# Altium schematic sheet Sheet1.SchDoc
size A3; SheetNumber: 1; SheetTotal: 1
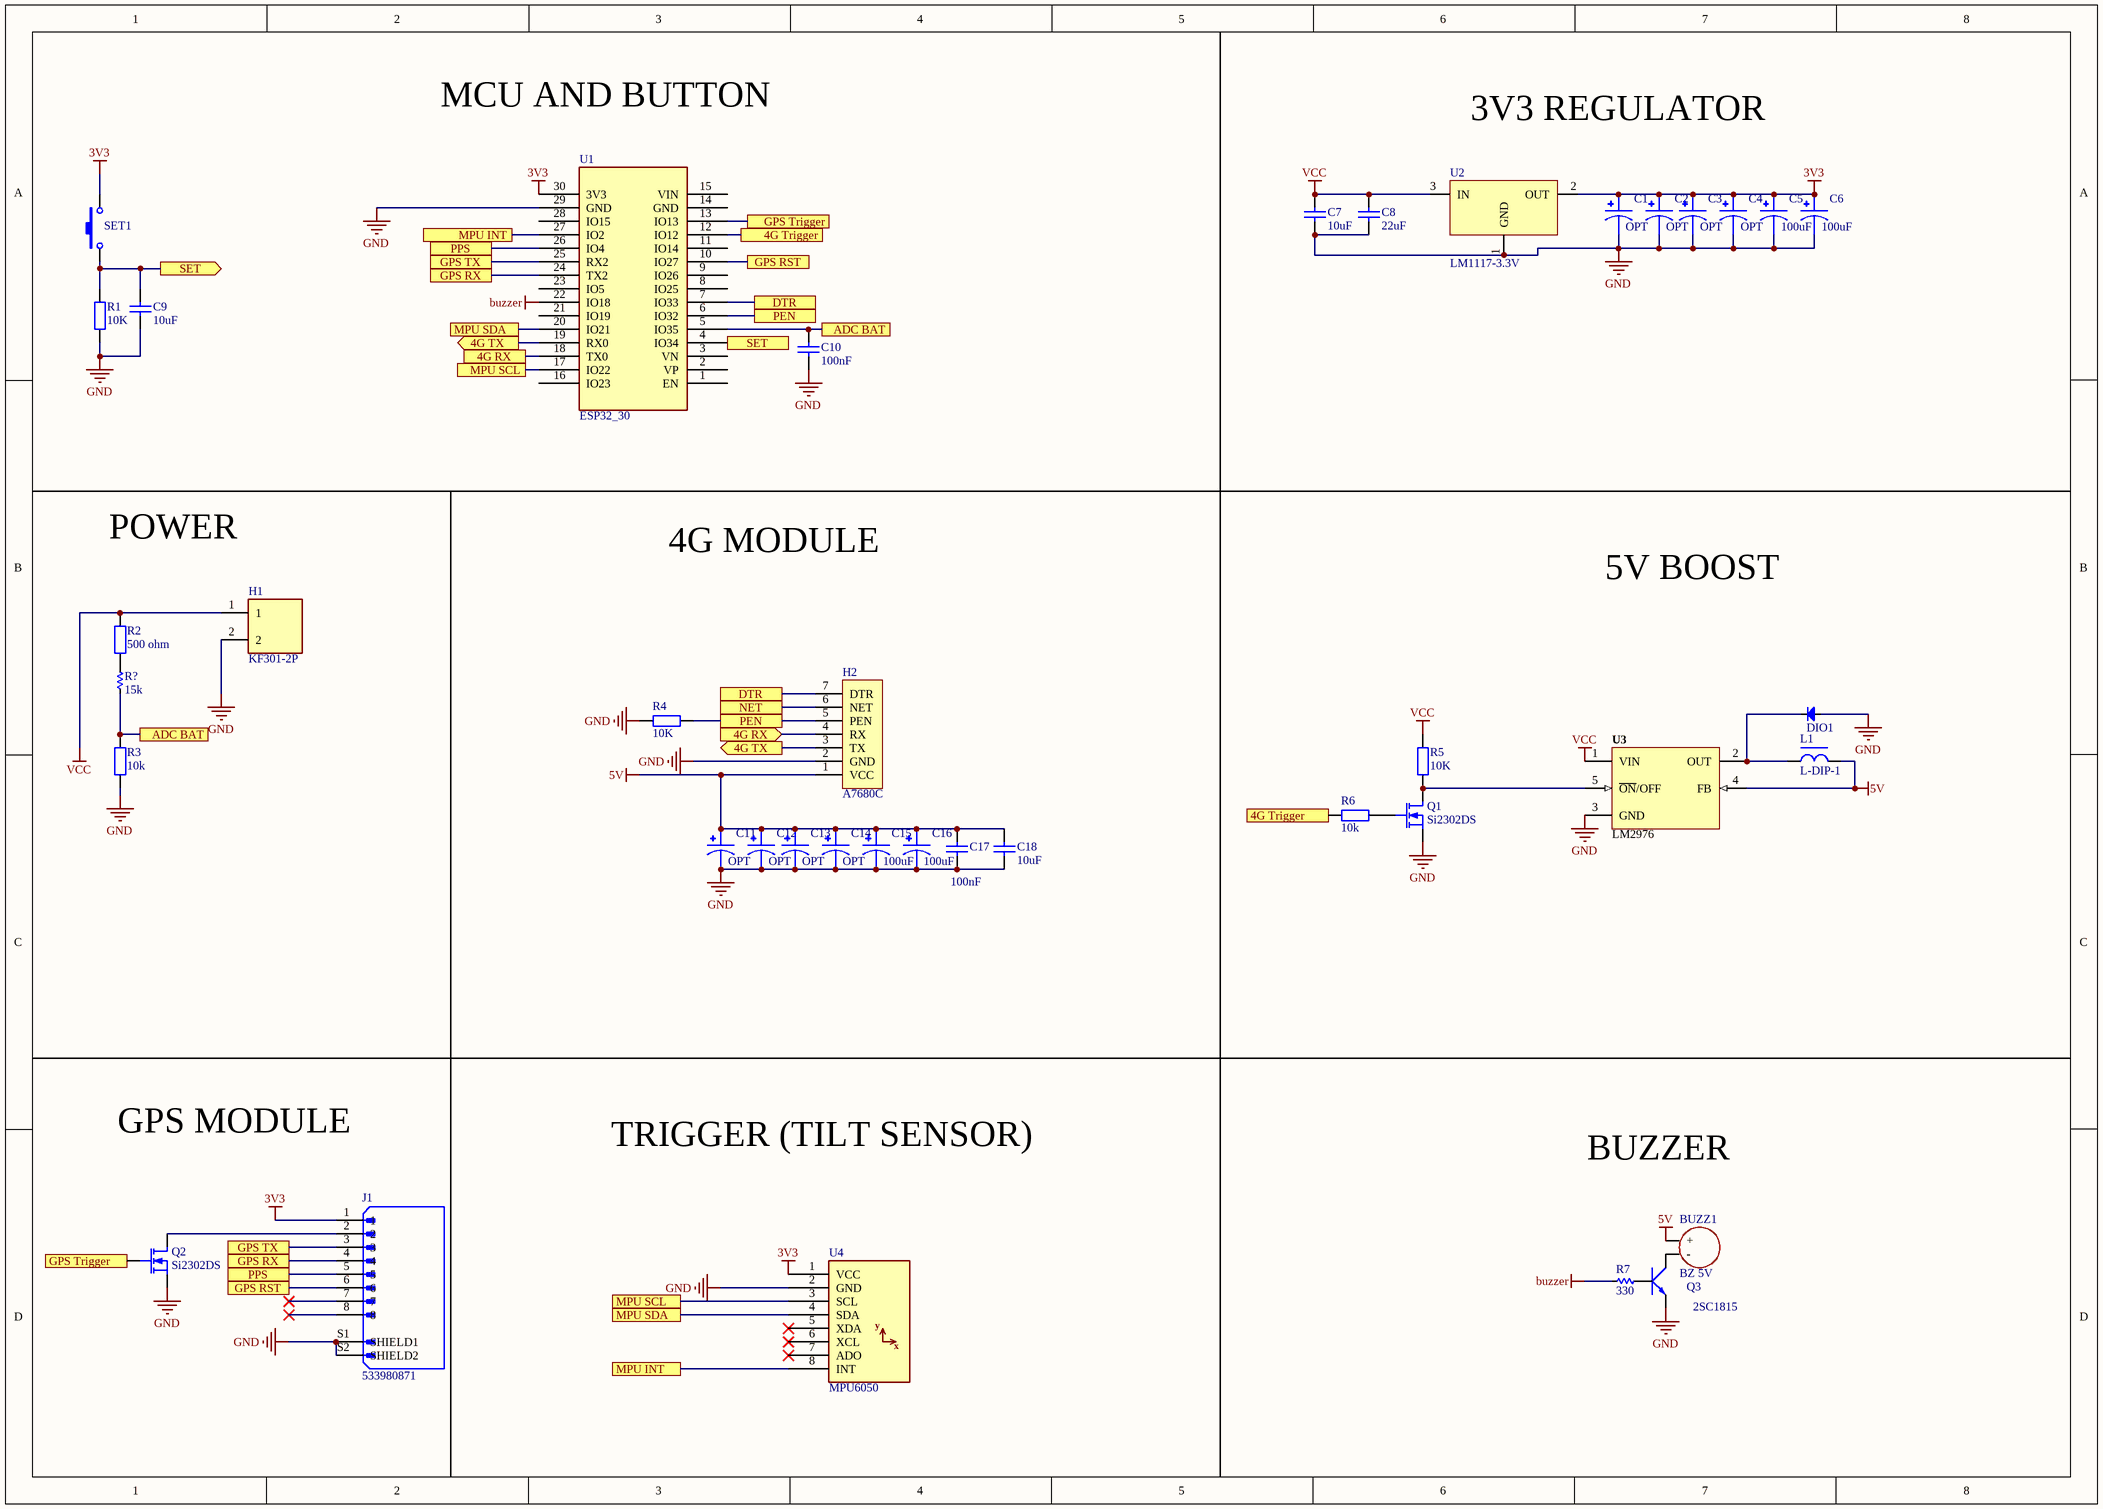
[diagram p0: Sheet1.SchDoc]

## Parts
BUZZ1  BZ 5V  [BUZ_9MM]
C1  OPT  [1206_Tantalum]
C2  OPT  [1206_Tantalum]
C3  OPT  [2312_Tantalum]
C4  OPT  [2312_Tantalum]
C5  100uF  [2917 _Tantalum]
C6  100uF  [2917 _Tantalum]
C7  10uF  [0805_Cap]
C8  22uF  [0805_Cap]
C9  10uF  [0805_Cap]
C10  100nF  [0805_Cap]
C11  OPT  [1206_Tantalum]
C12  OPT  [1206_Tantalum]
C13  OPT  [2312_Tantalum]
C14  OPT  [2312_Tantalum]
C15  100uF  [2917 _Tantalum]
C16  100uF  [2917 _Tantalum]
C17  100nF  [0805_Cap]
C18  10uF  [0805_Cap]
DIO1  Diode SMD  [DIO-SMD-A]  (value not drawn)
H1  KF301-2P  [HANDSON_KF301-2P]
H2  A7680C  [Module A7680C]
J1  533980871  [MOLEX_533980871]
L1  L-DIP-1  [L-DIP-M-15.5x8]
Q1  Si2302DS  [SOT23-132]
Q2  Si2302DS  [SOT23-132]
Q3  2SC1815  [SOT23-321]
R1  10K  [0805_Res]
R2  500 ohm  [0805_Res]
R3  10k  [0805_Res]
R4  10K  [0805_Res]
R5  10K  [0805_Res]
R6  10k  [0805_Res]
R7  330  [RES-SMD-0805]
R?  15k  [RES-SMD-0805]
SET1  Button 2p  [Button 2p 3x6x2.5]  (value not drawn)
U1  ESP32_30  [ESP32_30]
U2  LM1117-3.3V  [TO220NH]
U3  LM2976  [TO263]
U4  MPU6050  [MPU6050]

## Ports
4G RX, 4G RX (in), 4G Trigger, 4G TX (out), ADC BAT, DTR, GPS RST, GPS RX, GPS Trigger, GPS TX, MPU INT, MPU SCL, MPU SDA, NET, PEN, PPS, SET (out)

## Nets
3V3: C1.1 C2.1 C3.1 C4.1 C5.1 C6.1 J1.1 SET1.2 U1.30(3V3) U2.2(OUT) U4.1(VCC)
5V: BUZZ1.1(+) C11.1 C12.1 C13.1 C14.1 C15.1 C16.1 C17.1 C18.2 H2.1(VCC) L1.2 U3.4(FB)
buzzer: R7.2 U1.22(IO18)
GND: C1.2 C2.2 C3.2 C4.2 C5.2 C6.2 C7.1 C8.2 C9.2 C10.1 C11.2 C12.2 C13.2 C14.2 C15.2 C16.2 C17.2 C18.1 DIO1.1(A) H1.2 H2.2(GND) J1.S1(SHIELD1) J1.S2(SHIELD2) Q1.2(S) Q2.2(S) Q3.1(E) R1.1 R3.1 R4.2 U1.29(GND) U2.1(GND) U3.3(GND) U4.2(GND)
VCC: C7.2 C8.1 H1.1 R2.2 R5.2 U2.3(IN) U3.1(VIN)
4G RX: H2.4(RX) U1.18(TX0) ; port 4G RX
4G Trigger: R6.2 U1.12(IO12) ; port 4G Trigger
4G TX: H2.3(TX) U1.19(RX0) ; port 4G TX
ADC BAT: C10.2 R3.2 R?.2 U1.5(IO35) ; port ADC BAT
DTR: H2.7(DTR) U1.7(IO33) ; port DTR
GPS RST: J1.6 U1.10(IO27) ; port GPS RST
GPS RX: J1.4 U1.24(TX2) ; port GPS RX
GPS Trigger: Q2.1(G) U1.13(IO13) ; port GPS Trigger
GPS TX: J1.3 U1.25(RX2) ; port GPS TX
MPU INT: U1.27(IO2) U4.8(INT) ; port MPU INT
MPU SCL: U1.17(IO22) U4.3(SCL) ; port MPU SCL
MPU SDA: U1.20(IO21) U4.4(SDA) ; port MPU SDA
NET: H2.6(NET) ; port NET
PEN: H2.5(PEN) R4.1 U1.6(IO32) ; port PEN
PPS: J1.5 U1.26(IO4) ; port PPS
SET: C9.1 R1.2 SET1.1 U1.4(IO34) ; port SET
NetBUZZ1_2: BUZZ1.2(-) Q3.2(C)
NetDIO1_2: DIO1.2(K) L1.1 U3.2(OUT)
NetJ1_2: J1.2 Q2.3(D)
NetQ1_1: Q1.1(G) R6.1
NetQ1_3: Q1.3(D) R5.1 U3.5(~{ON}/OFF)
NetQ3_3: Q3.3(B) R7.1
NetR2_1: R2.1 R?.1

Not connected (* = marked no-connect by the designer): J1 7* 8*; U1 1(EN) 2(VP) 3(VN) 8(IO25) 9(IO26) 11(IO14) 14(GND) 15(VIN) 16(IO23) 21(IO19) 23(IO5) 28(IO15); U4 5(XDA)* 6(XCL)* 7(ADO)*

## Notes on the sheet
- MCU AND BUTTON
- 3V3 REGULATOR
- POWER
- 4G MODULE
- 5V BOOST
- GPS MODULE
- TRIGGER (TILT SENSOR)
- BUZZER
- (in symbol MPU6050) y; x

## Library data of the parts
BUZZ1 = Buzzer 5V 9mm (THD): Buzzers Transducer, Externally Driven Magnetic 5V 80mA 2.73kHz 85dB @ 5V, 10cm Through Hole PC Pins; PartNumber: CST-951AP
C1-C6 C11-C16 = Tantalum: Molded Tantalum Capacitors
C7 C8 = Ceramic Capacitor_1: Chung_Loai: Dán; Don_Vi: Con; So_Chan: 2; Ten_Linh_Kien: Tụ 0805 104-100nF 10% 50V; Ma_Hang: MH004551; Kieu_Chan: *
C9 C10 C17 C18 = Ceramic Capacitor: Chung_Loai: Dán; Don_Vi: Con; So_Chan: 2; Ten_Linh_Kien: Tụ 0805 104-100nF 10% 50V; Ma_Hang: MH004551; Kieu_Chan: *
DIO1 = Diode SMD: Default Diode; Code - JEDEC: DO-214-AB; Value: 1N5007; Published: 8-Jun-2000; Revision: July-2002: Re-released for DXP Platform.; Publisher: Altium Limited
H1 = KF301-2P: 2 Pin Terminal Block 5mm Pitch; Price: None; Value: *; MP: KF301-2P; Package: None; Availability: Unavailable
H2 = Module A7680C: SIM Module A7680C; A7672S 4G
J1 = 533980871: MX 1.25mm 8 pin;Conn; Rect; Header; 1.25 mm Pitch; PCB; 8 Cir; Ver; SMT; PicoBlade; LF | Molex Incorporated 53398-0871; Price: None; MP: 533980871; Availability: Unavailable; Value: *; Package: None
L1 = L-DIP-1: Inductor; Value: 150 mH
Q1 Q2 = Si2302DS: N-Channel MOSFET; Published: 8-Jun-2000; LatestRevisionDate: 17-Jul-2002; LatestRevisionNote: Re-released for DXP Platform.; PackageVersion: 1995/1996; PackageReference: E3; Publisher: Altium Limited; PackageDescription: TO, Flat Index; 3 In-Line, Axial Leads; Body Dia. 4.6mm; Lead Dia. 0.5 mm (max)
Q3 = 2SC1815: NPN 600mW, ECB; Value: C1815
R1-R6 = Resistor: Chung_Loai: Dán; Don_Vi: Con; So_Chan: 2; Ten_Linh_Kien: Trở 0805 1% 1k; Ma_Hang: MH005468; Kieu_Chan: *
R7 R? = Res-SMD: Resistor; Manufacturer: Generic Components; Class: Passive; Published: 08/06/2000; Publisher: Altium Hobart Technology Centre
SET1 = Button 2p: Nut Nhan 2 Chan SMD 3x6x2.5; Ma_Hang: MH001036; Ten: Nút Nhấn 2 Chân 3x6x2.5MM SMD
U1 = ESP32_30: Microcontoller Board 30 Pins Wifi 2.4GHz BLE 4.2 ESP32-WROOM-32D; ComponentLink1Description: Datasheet; ComponentLink1URL: https://www.mouser.com/datasheet/2/891/esp32_wroom_32d_esp32_wroom_32u_datasheet_en-1365844.pdf
U2 = LM1117: 800mA Low-Dropout Linear Regulator; Creator: Nguyen Ba Bien; Website: http://group3i.net
U3 = LM2596: Max Input Voltage: 12 V; Max Output Current: 3 (6.0 peak) A; Max Output Voltage: mV; Category: IC-Power; Min Input Voltage: mV; Min Output Voltage: mV; Mounting Technology: Surface Mount; Status: Unreleased; Supply Voltage: mV; Temperature Range: -40 to +125 degC
U4 = MPU6050: IMU ACCEL/GYRO 3-AXIS I2C; ComponentLink1Description: Datasheet; ComponentLink1URL: https://invensense.tdk.com/wp-content/uploads/2015/02/MPU-6000-Datasheet1.pdf